# EAGLE design TLC._V_1_1_3 (EAGLE 9.6.2)
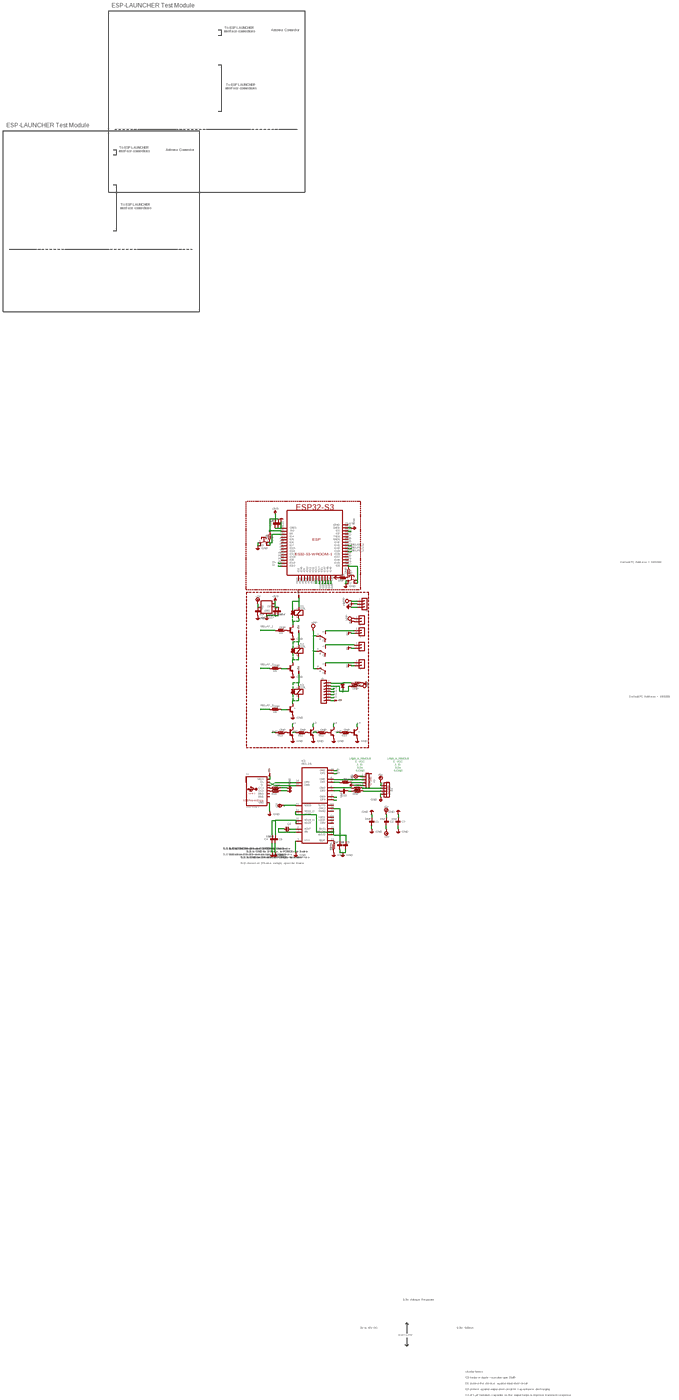
[diagram p0: schematic, sheet 1, overview]
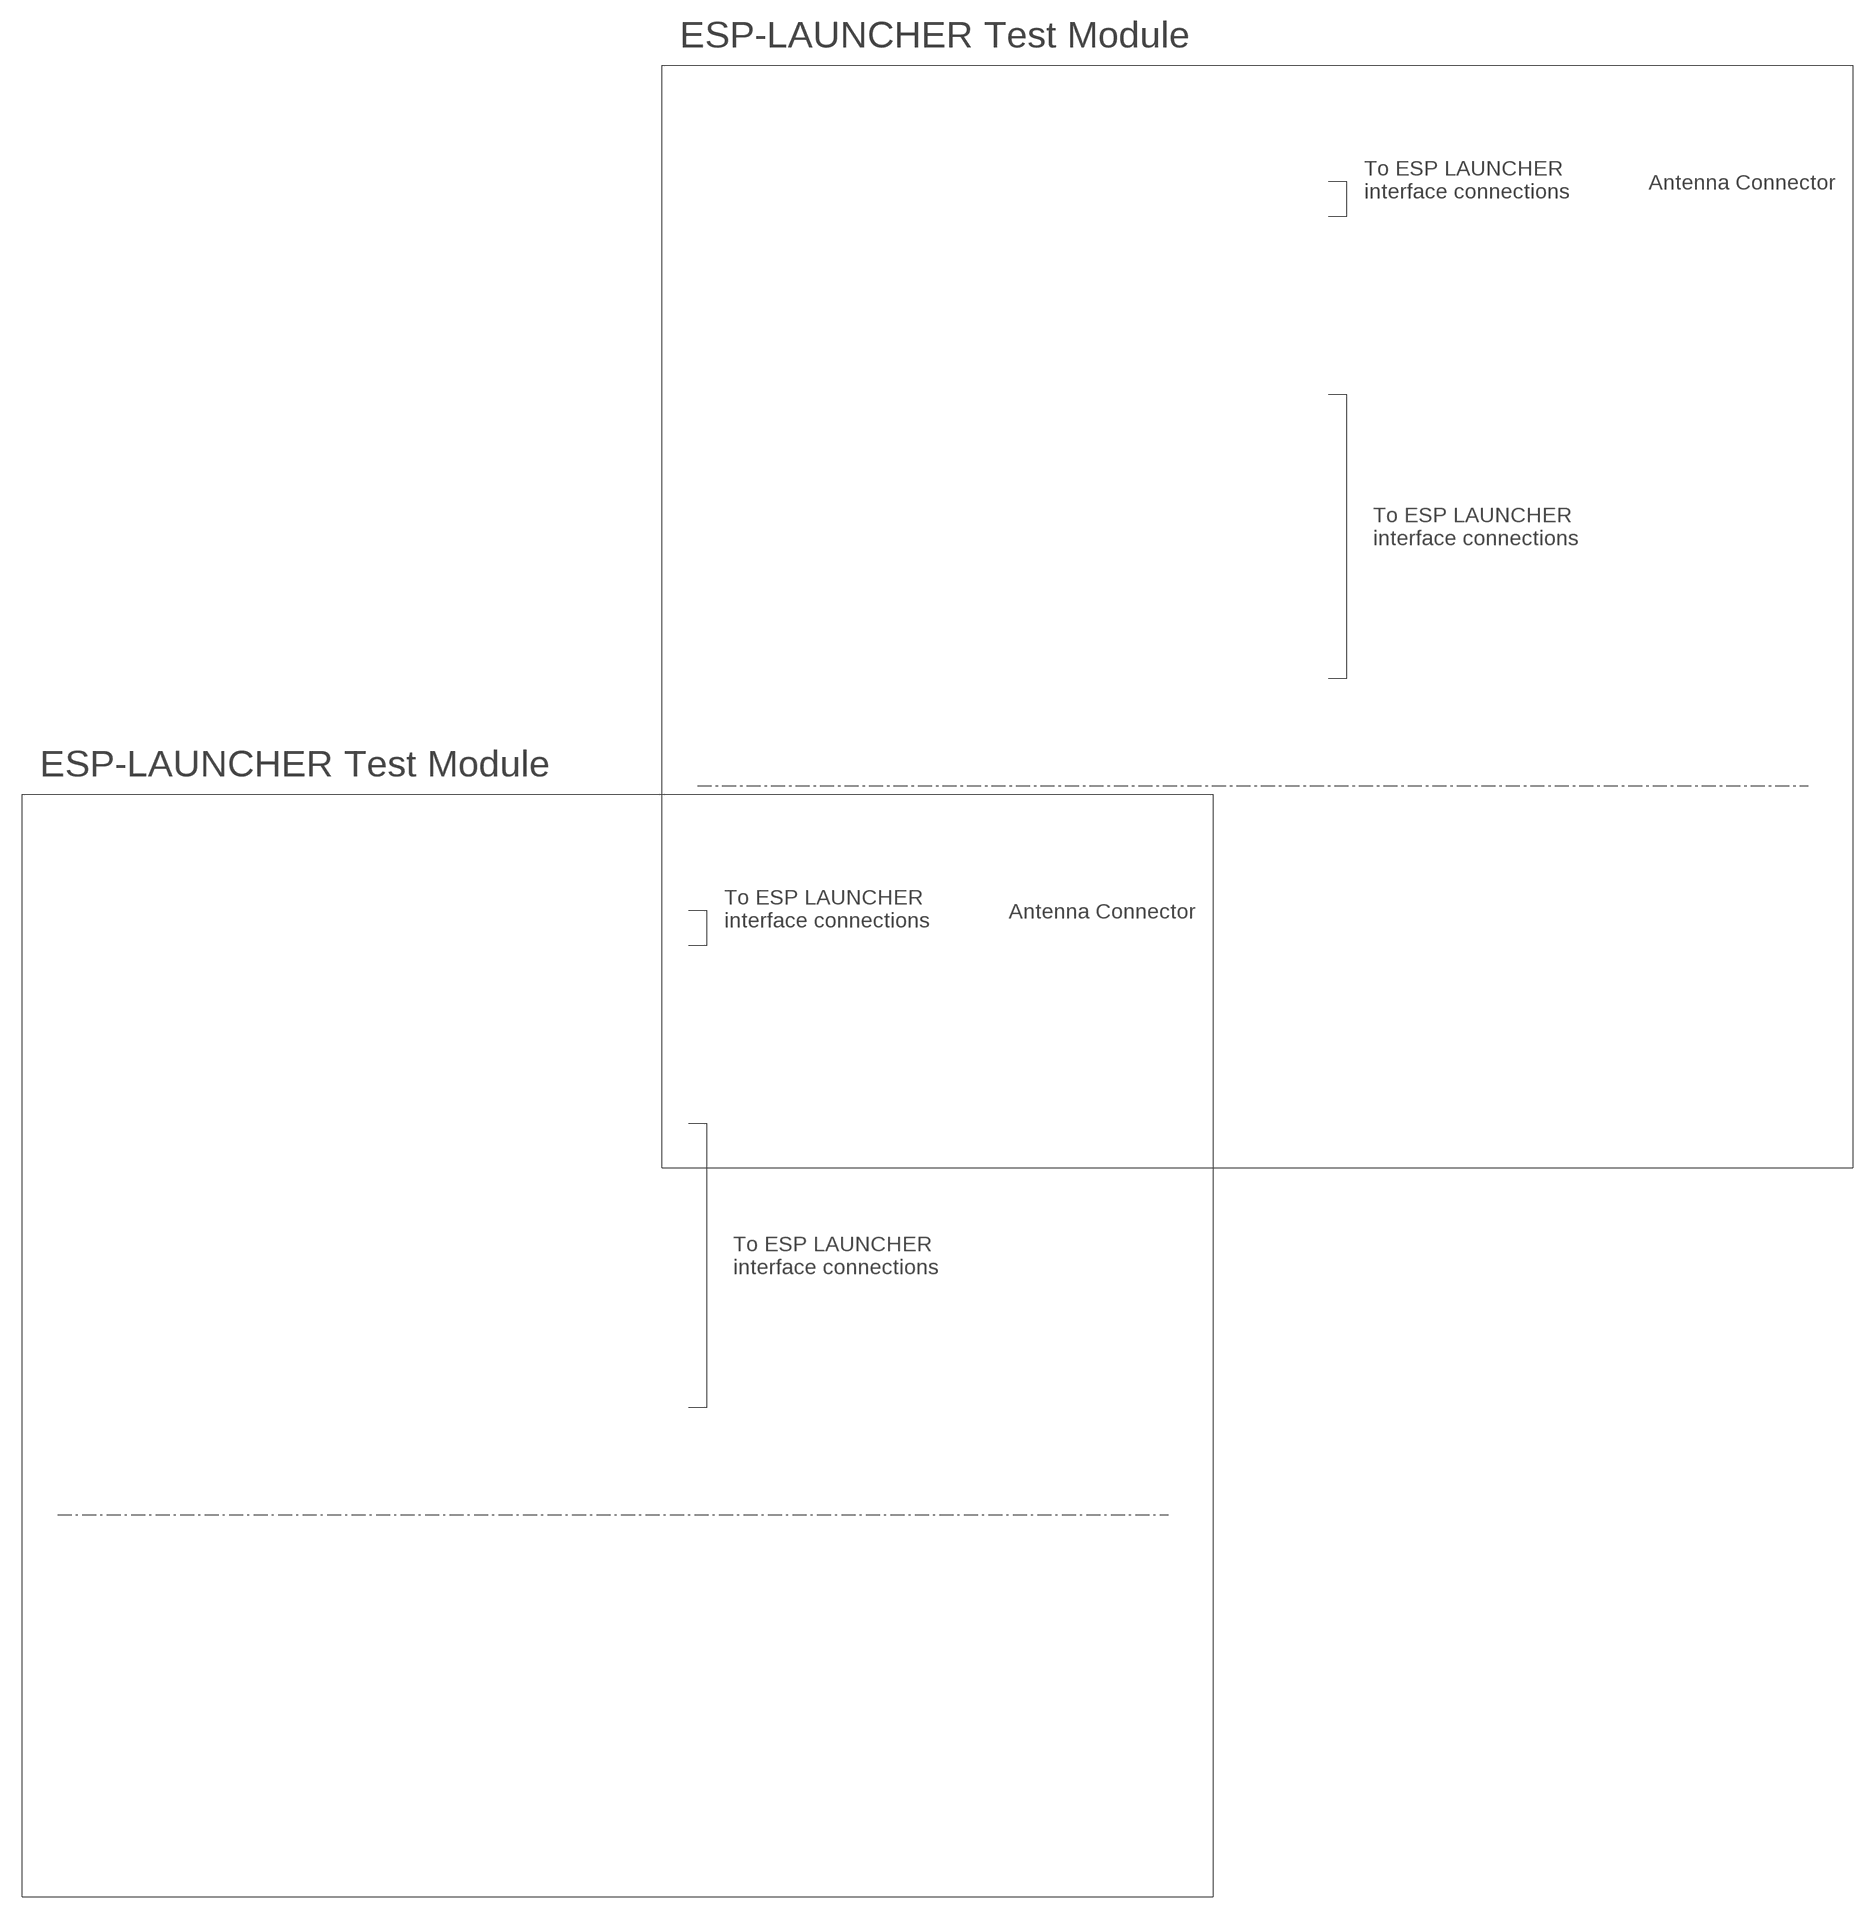
[diagram p1: schematic, sheet 1, part 1 of 4]
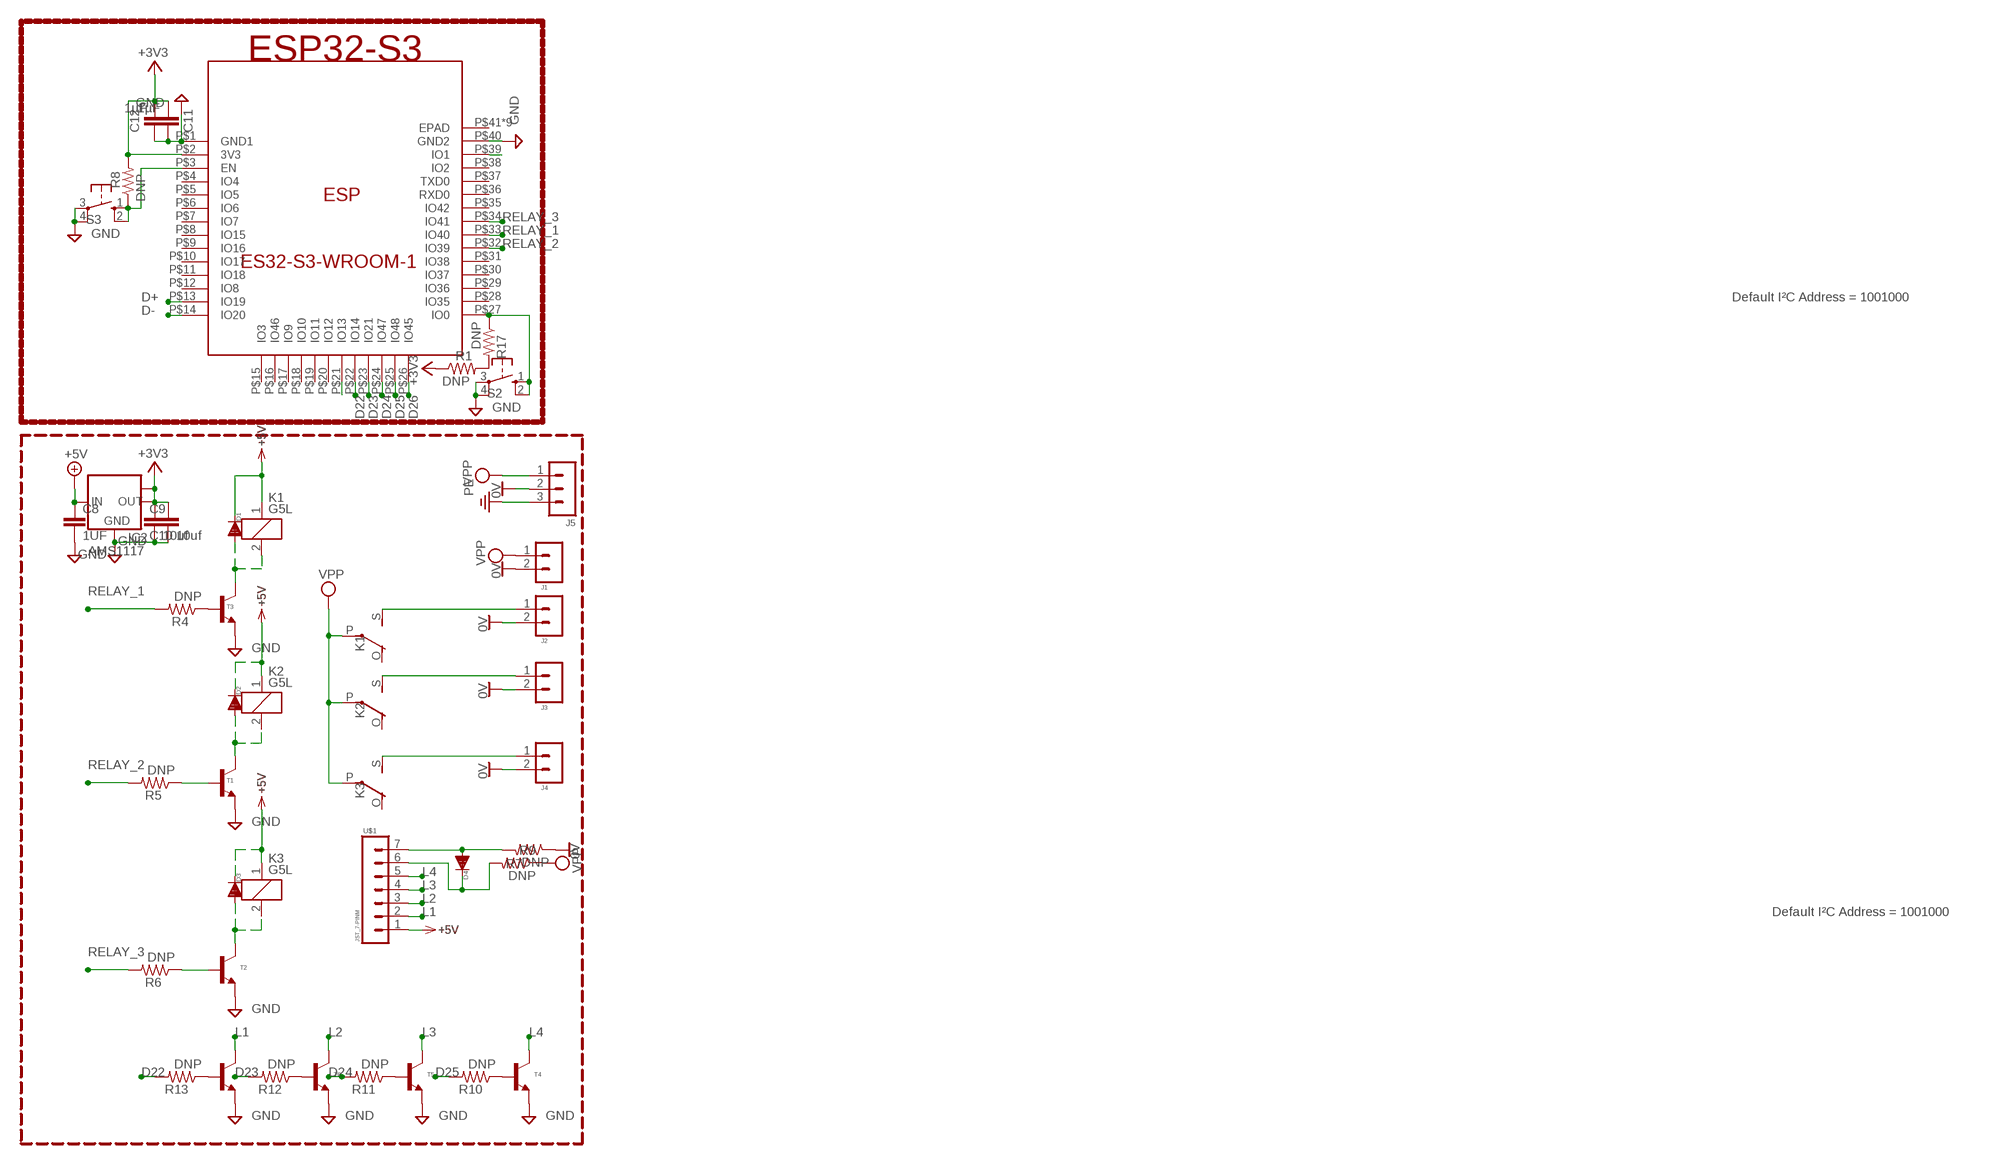
[diagram p2: schematic, sheet 1, part 2 of 4]
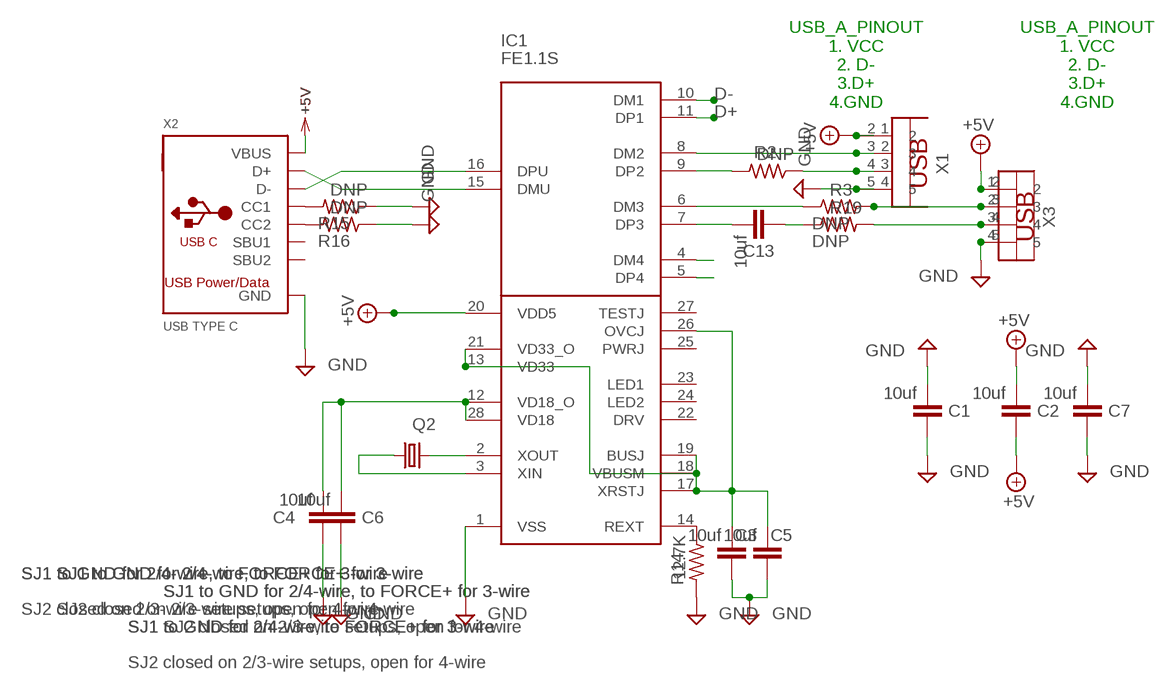
[diagram p3: schematic, sheet 1, part 3 of 4]
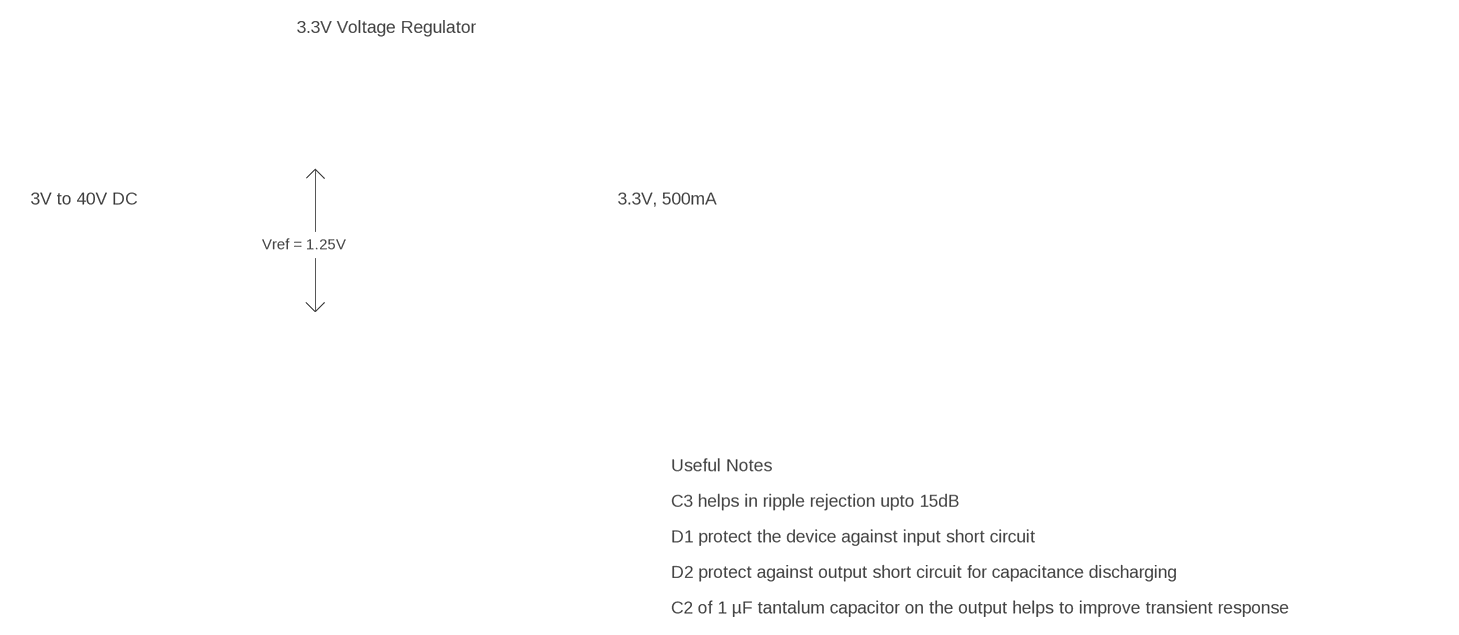
[diagram p4: schematic, sheet 1, part 4 of 4]

## Parts
C1  10uf  C-EUC1206K  [C1206K]
C2  10uf  C-EUC1206K  [C1206K]
C3  10uf  C-EUC1206K  [C1206K]
C4  10uf  C-EUC1206K  [C1206K]
C5  10uf  C-EUC1206K  [C1206K]
C6  10uf  C-EUC1206K  [C1206K]
C7  10uf  C-EUC1206K  [C1206K]
C8  1UF  C-EUC1206K  [C1206K]
C9  10uf  C-EUC1206K  [C1206K]
C10  10uf  C-EUC1206K  [C1206K]
C11  1µF  C-EUC0805K  [C0805K]
C12  1µF  C-EUC0805K  [C0805K]
C13  10uf  C-EUC1206K  [C1206K]
D1  DIODE80  [SOD-80]
D2  DIODE80  [SOD-80]
D3  DIODE80  [SOD-80]
D4  DIODE80  [SOD-80]
ESP  ES32-S3-WROOM-1  [ESP32-S3-WROOM-1]
IC1  FE1.1S  [SOP64P600X175-28N]
IC2  AMS1117  LM1117MPX-5.0  [SOT223]
J1  JST_2-PIN_1.27MMBPT_3.5MM  [BPT-2_PIN_3.5MM]
J2  JST_2-PIN_1.27MMBPT_3.5MM  [BPT-2_PIN_3.5MM]
J3  JST_2-PIN_1.27MMBPT_3.5MM  [BPT-2_PIN_3.5MM]
J4  JST_2-PIN_1.27MMBPT_3.5MM  [BPT-2_PIN_3.5MM]
J5  JST_3-PINPWR_3  [3-PIN_3.96_PWR]
K1  G5L  [G5LE]
K2  G5L  [G5LE]
K3  G5L  [G5LE]
Q2  CRYSTALSM49  [SM49]
R1  DNP  R-US_VMTB60  [VMTB60]
R2  DNP  R-US_R1206  [R1206]
R3  DNP  R-US_VMTB60  [VMTB60]
R4  DNP  R-US_R0603  [R0603]
R5  DNP  R-US_R0603  [R0603]
R6  DNP  R-US_R1206  [R1206]
R7  DNP  R-US_R0603  [R0603]
R8  DNP  R-US_R0603  [R0603]
R9  DNP  R-US_R0603  [R0603]
R10  DNP  R-US_R0603  [R0603]
R11  DNP  R-US_R0603  [R0603]
R12  DNP  R-US_R0603  [R0603]
R13  DNP  R-US_R0603  [R0603]
R14  12.7K  R-US_R0805  [R0805]
R15  DNP  R-US_R1206  [R1206]
R16  DNP  R-US_R0603  [R0603]
R17  DNP  R-US_R0805  [R0805]
R19  DNP  R-US_VMTB60  [VMTB60]
S2  10-XX  [B3F-10XX]
S3  10-XX  [B3F-10XX]
T1  TRANSISTOR_NPNSOT-23  [SOT-23]
T2  TRANSISTOR_NPNSOT-23  [SOT-23]
T3  TRANSISTOR_NPNSOT-23  [SOT-23]
T4  TRANSISTOR_NPNSOT-23  [SOT-23]
T5  TRANSISTOR_NPNSOT-23  [SOT-23]
T6  TRANSISTOR_NPNSOT-23  [SOT-23]
T7  TRANSISTOR_NPNSOT-23  [SOT-23]
U$1  JST_7-PINM  [MOLEX_7-PIN]
U$2  1.27_4PIN  [1.27_4PIN]
U$3  1.27_4PIN  [1.27_4PIN]
X1  PN87520  [PN87520]
X2  USB TYPE C  USB_C  [USB_C_CUSB31-CFM2AX-01-X]
X3  PN87520  [PN87520]

## Nets
0V: J1.2 J2.2 J3.2 J4.2 J5.2 R9.1
+3V3: C9.1 C10.1 C11.2 C12.2 ESP.P$2(3V3) IC2.2(OUT) IC2.TAB(OUT1) R1.1 R8.2
+5V: C2.1 C2.2 C8.1 D1.K D2.K D3.K IC1.20(VDD5) IC2.3(IN) K1.1 K2.1 K3.1 U$1.1 U$2.2 U$3.2 X1.1 X2.A4B9(VBUS) X2.B4A9(VBUS) X3.1
D22: ESP.P$22(IO14) R13.2
D23: ESP.P$23(IO21) R12.2
D24: ESP.P$24(IO47) R11.2
D25: ESP.P$25(IO48) R10.2
D26: ESP.P$26(IO45)
D+: ESP.P$13(IO19) IC1.11(DP1)
D-: ESP.P$14(IO20) IC1.10(DM1)
GND: C1.1 C1.2 C3.1 C4.1 C5.1 C6.1 C7.1 C7.2 C8.2 C9.2 C10.2 C11.1 C12.1 ESP.P$1(GND1) ESP.P$40(GND2) IC1.1(VSS) IC2.1(GND) R14.2 R15.1 R16.1 S2.3(P) S2.4(P1) S3.3(P) S3.4(P1) T1.2(E) T2.2(E) T3.2(E) T4.2(E) T5.2(E) T6.2(E) T7.2(E) U$2.5 U$3.5 X1.4 X2.A1B12(GND) X2.B1A12(GND) X3.4
L1: T7.3(C) U$1.2
L2: T6.3(C) U$1.3
L3: T5.3(C) U$1.4
L4: T4.3(C) U$1.5
N$1: R3.2 U$2.3 X3.2
N$2: C13.2 IC1.7(DP3)
N$3: ESP.P$39(IO1)
N$4: ESP.P$21(IO13)
N$5: IC1.8(DM2) U$3.3 X1.2
N$6: R5.1 T1.1(B)
N$7: D4.K R7.2 U$1.6
N$8: R4.1 T3.1(B)
N$9: J4.1 K3.S(2:S)
N$10: D1.A K1.2 T3.3(C)
N$11: D4.A R9.2 U$1.7
N$12: D2.A K2.2 T1.3(C)
N$13: R10.1 T4.1(B)
N$14: R6.1 T2.1(B)
N$15: ESP.P$3(EN) R8.1 S3.1(S) S3.2(S1)
N$16: R19.2 U$2.4 X3.3
N$17: IC1.4(DM4)
N$18: D3.A K3.2 T2.3(C)
N$19: J3.1 K2.S(2:S)
N$20: J2.1 K1.S(2:S)
N$21: IC1.2(XOUT) Q2.2
N$22: R11.1 T5.1(B)
N$23: IC1.3(XIN) Q2.1
N$24: R12.1 T6.1(B)
N$25: IC1.14(REXT) R14.1
N$26: R13.1 T7.1(B)
N$27: IC1.5(DP4)
N$28: C3.2 C5.2 IC1.13(VD33) IC1.17(XRSTJ) IC1.18(VBUSM) IC1.19(BUSJ) IC1.21(VD33_O) IC1.26(OVCJ)
N$29: ESP.P$27(IO0) R17.1 S2.1(S) S2.2(S1)
N$30: C4.2 C6.2 IC1.12(VD18_O) IC1.28(VD18)
N$31: IC1.9(DP2) R2.2
N$32: IC1.16(DPU) X2.A7(D-) X2.B7(D-)
N$33: IC1.15(DMU) X2.A6(D+) X2.B6(D+)
N$34: R15.2 X2.A5(CC1)
N$35: R16.2 X2.B5(CC2)
N$36: R2.1 U$3.4 X1.3
N$37: R1.2 R17.2
N$38: IC1.6(DM3) R3.1
N$39: C13.1 R19.1
PE: J5.3
RELAY_1: ESP.P$33(IO40) R4.2
RELAY_2: ESP.P$32(IO39) R5.2
RELAY_3: ESP.P$34(IO41) R6.2
VPP: J1.1 J5.1 K1.P(2:P) K2.P(2:P) K3.P(2:P) R7.1
Unconnected: ESP.P$4(IO4) ESP.P$5(IO5) ESP.P$6(IO6) ESP.P$7(IO7) ESP.P$8(IO15) ESP.P$9(IO16) ESP.P$10(IO17) ESP.P$11(IO18) ESP.P$12(IO8) ESP.P$15(IO3) ESP.P$16(IO46) ESP.P$17(IO9) ESP.P$18(IO10) ESP.P$19(IO11) ESP.P$20(IO12) ESP.P$28(IO35) ESP.P$29(IO36) ESP.P$30(IO37) ESP.P$31(IO38) ESP.P$35(IO42) ESP.P$36(RXD0) ESP.P$37(TXD0) ESP.P$38(IO2) ESP.P$41(EPAD) ESP.P$42(EPAD) ESP.P$43(EPAD) ESP.P$44(EPAD) ESP.P$45(EPAD) ESP.P$46(EPAD) ESP.P$47(EPAD) ESP.P$48(EPAD) ESP.P$49(EPAD) IC1.22(DRV) IC1.23(LED1) IC1.24(LED2) IC1.25(PWRJ) IC1.27(TESTJ) K1.O(2:O) K2.O(2:O) K3.O(2:O) X2.A8(SBU1) X2.B8(SBU2)

## Notes on the sheet
- ESP-LAUNCHER Test Module
- Antenna Connector
- To ESP LAUNCHER
  interface connections
- To ESP LAUNCHER
  interface connections
- ESP-LAUNCHER Test Module
- Antenna Connector
- To ESP LAUNCHER
  interface connections
- To ESP LAUNCHER
  interface connections
- Default I²C Address = 1001000
- Default I²C Address = 1001000
- USB_A_PINOUT
  1. VCC
  2. D-
  3.D+
  4.GND
- USB_A_PINOUT
  1. VCC
  2. D-
  3.D+
  4.GND
- USB Power/Data
- SJ1 to GND for 2/4-wire, to FORCE+ for 3-wire | SJ1 to GND for 2/4-wire, to FORCE+ for 3-wire | SJ1 to GND for 2/4-wire, to FORCE+ for 3-wire | SJ1 to GND for 2/4-wire, to FORCE+ for 3-wire
- SJ1 to GND for 2/4-wire, to FORCE+ for 3-wire | SJ1 to GND for 2/4-wire, to FORCE+ for 3-wire
- SJ2 closed on 2/3-wire setups, open for 4-wire | SJ2 closed on 2/3-wire setups, open for 4-wire
- SJ1 to GND for 2/4-wire, to FORCE+ for 3-wire | SJ1 to GND for 2/4-wire, to FORCE+ for 3-wire | SJ2 closed on 2/3-wire setups, open for 4-wire
- SJ2 closed on 2/3-wire setups, open for 4-wire
- 3.3V Voltage Regulator
- 3V to 40V DC | 3.3V, 500mA
- Vref = 1.25V
- Useful Notes
- C3 helps in ripple rejection upto 15dB
- D1 protect the device against input short circuit
- D2 protect against output short circuit for capacitance discharging
- C2 of 1 µF tantalum capacitor on the output helps to improve transient response

## Library data of the parts
C1-C13 = rcl:C-EU: CAPACITOR, European symbol; SPICEPREFIX: C
D1-D4 = Squadron:DIODE
ESP = ESP32 Module:ES32-S3-WROOM-1
IC1 = FE1.1S:FE1.1S: Check availability <https://pricing.snapeda.com/parts/FE1.1S/terminus/view-part?ref=eda>; AVAILABILITY: In Stock; CHECK_PRICES: https://www.snapeda.com/parts/FE1.1S/Terminus/view-part/?ref=eda; DESCRIPTION: USB 2.0 HIGH SPEED 4-PORT HUB CONTROLLER; MF: terminus; MP: FE1.1S; PACKAGE: None; PRICE: None; SNAPEDA_LINK: https://www.snapeda.com/parts/FE1.1S/Terminus/view-part/?ref=snap
IC2 = lm1117:LM1117MPX-*
J1-J4 = Squadron:JST_2-PIN_1.27MM
J5 = Squadron:JST_3-PIN
K1-K3 = relay:G5L: RELAY 1 x switch, 10 A/120 V AC, 8 A/30 V ADC, Omron
Q2 = adafruit:CRYSTAL: CRYSTAL; OC_FARNELL: unknown; OC_NEWARK: unknown
R1-R17 R19 = rcl:R-US_: RESISTOR, American symbol; SPICEPREFIX: R
S2 S3 = switch-omron:10-XX: OMRON SWITCH; MPN: B3F-1000; OC_FARNELL: 176432; OC_NEWARK: 36M3542
T1-T7 = Squadron:TRANSISTOR_NPN
U$1 = Squadron:JST_7-PIN
U$2 U$3 = 1.27mm connector:1.27_4PIN
X1 X3 = con-berg:PN87520: BERG USB connector; OC_FARNELL: unknown; OC_NEWARK: unknown
X2 = adafruit_electromech:USB_C: USB Type-C USB 2.0 Connector

## Module WAVESHAREDISPLAY
Ports: 

### Library data of the parts

## Board
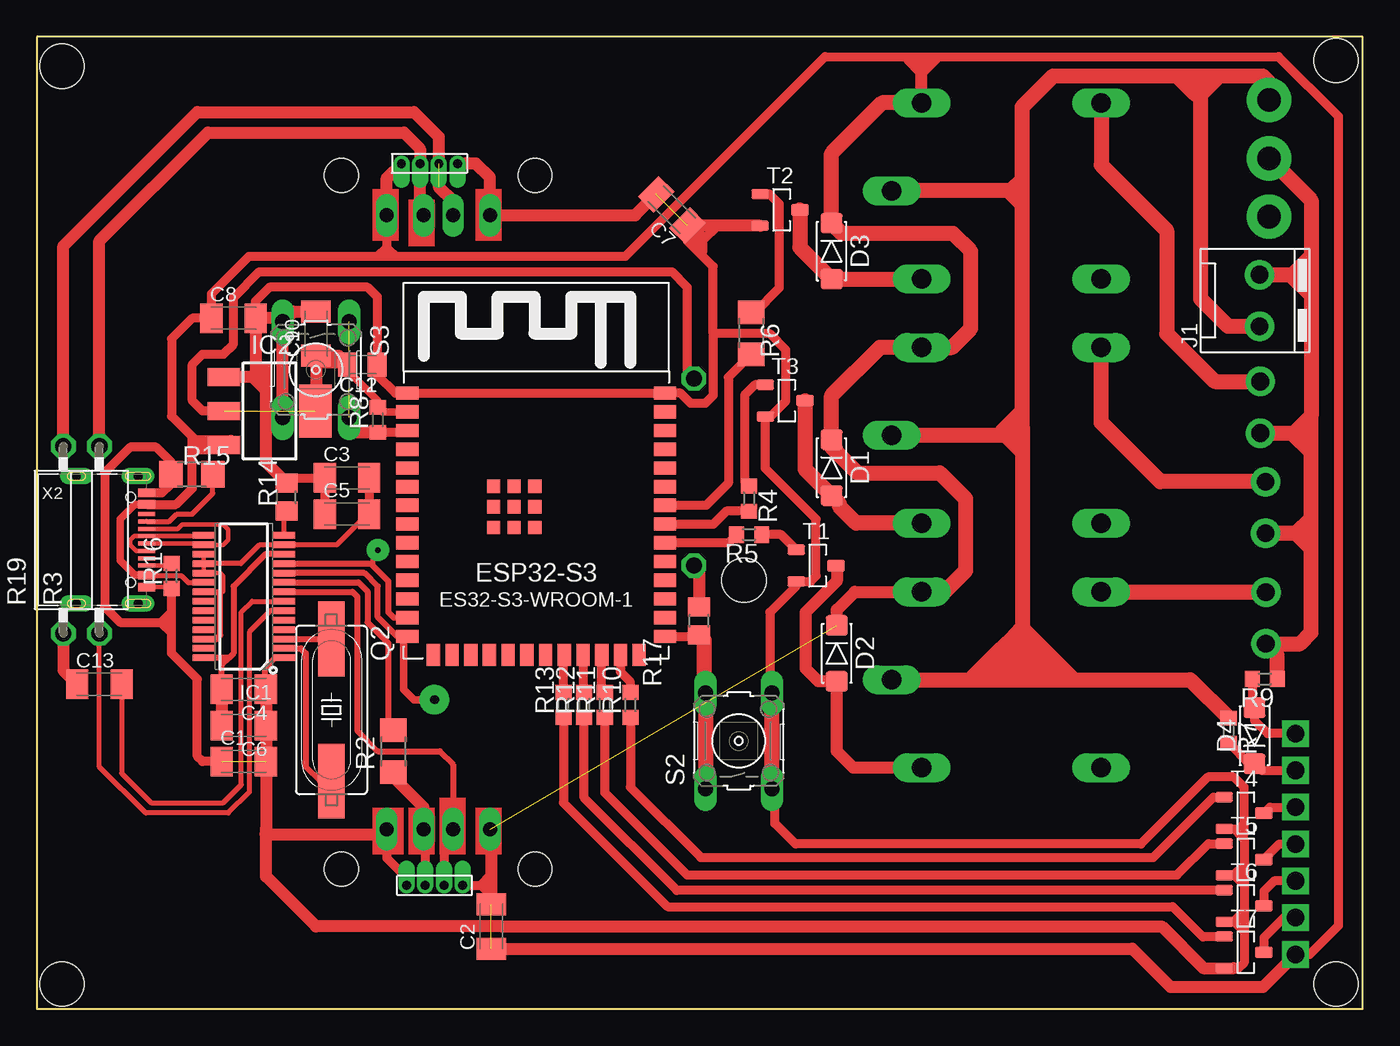
[diagram p5: board, top side]
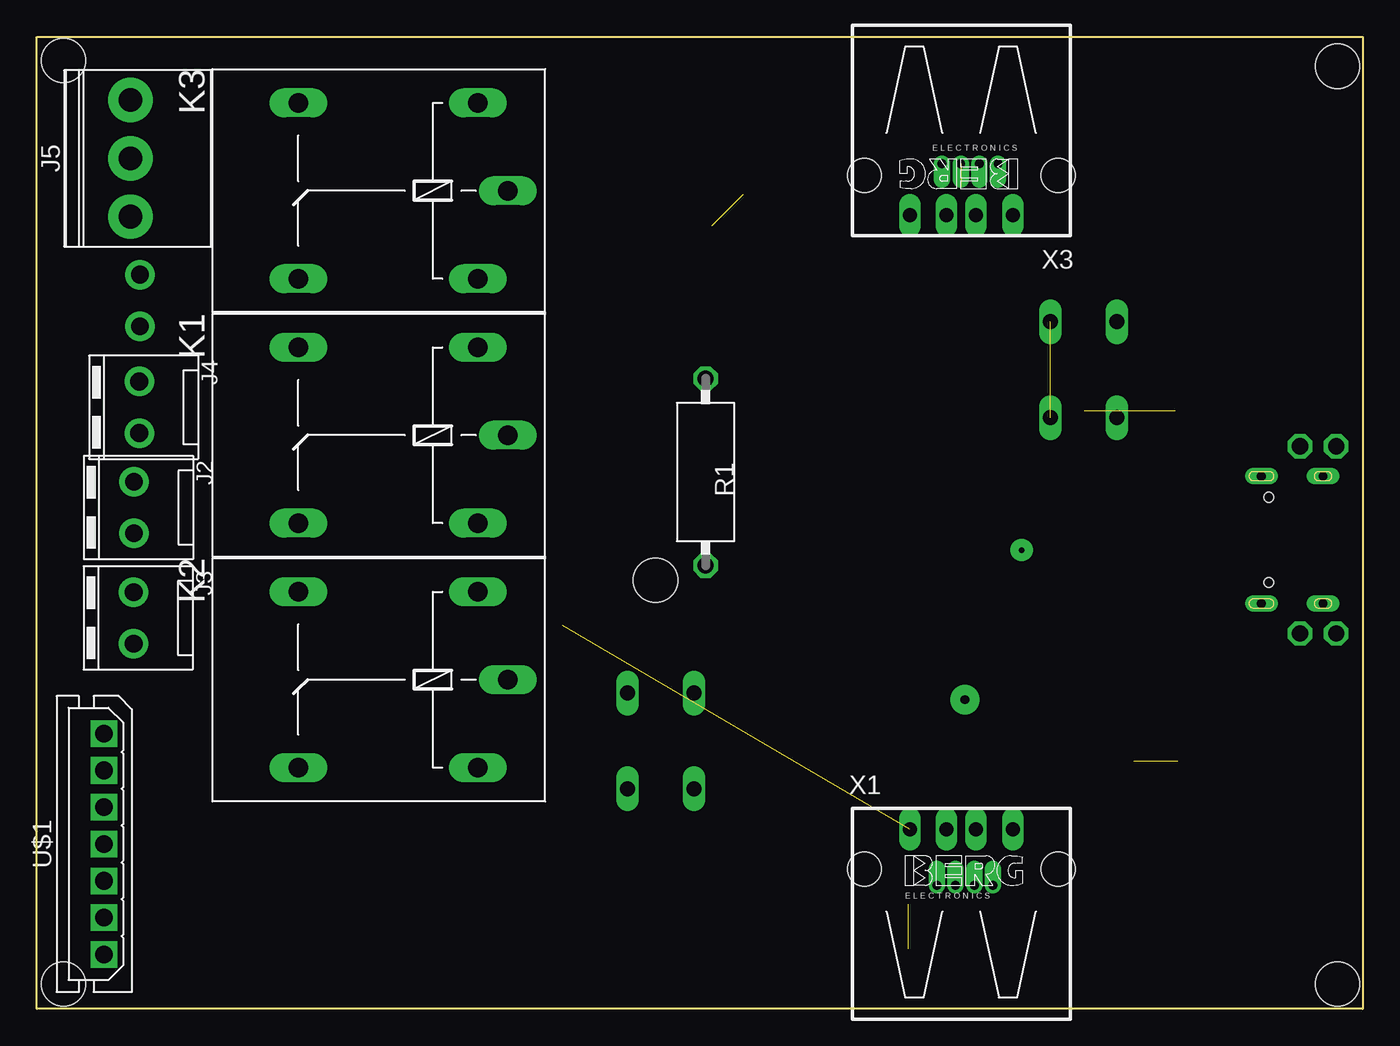
[diagram p6: board, bottom side, seen from below]

Size 90 x 66 mm. Coordinates in mm from the lower left corner, seen from the top.
Outline: 0,0 90,0 90,66 0,66 0,0
Copper layers (1*16): Top 0.035mm / dielectric 1.5mm / Bottom 0.035mm
Design rules "default": minimum track width 6mil, minimum drill 0.35mm, track to track 6mil, track to pad 6mil, pad to pad 6mil, via to via 6mil, smd to smd 6mil, copper to edge 40mil, drill to drill 6mil, minimum pad ring 10mil, minimum via ring 8mil, stop-mask expansion 4mil, vias tented up to drill 0mil, thermal gap 10mil
Holes 3 mm at 1.7,1.7 1.7,64 88.2,64.4 88.2,1.7 48,29.1

### Footprints (pad centres in the part's own frame; a part is rotated, then mirrored left to right if it is on the bottom)
C1206K = smd 1.5 x 2: 1 -1.5,0; 2 1.5,0
C0805K = smd 1.3 x 1.6: 1 -1,0; 2 1,0
SOD-80 = smd 1.4 x 1.5: A -1.9,0; K 1.9,0
ESP32-S3-WROOM-1 = smd 1.5 x 0.9: P$1 0.25,18.01; P$2 0.25,16.74; P$3 0.25,15.47; P$4 0.25,14.2; P$5 0.25,12.93; P$6 0.25,11.66; P$7 0.25,10.39; P$8 0.25,9.12; P$9 0.25,7.85; P$10 0.25,6.58; P$11 0.25,5.31; P$12 0.25,4.04; P$13 0.25,2.77; P$14 0.25,1.5; P$27 17.75,1.5; P$28 17.75,2.77; P$29 17.75,4.04; P$30 17.75,5.31; P$31 17.75,6.58; P$32 17.75,7.85; P$33 17.75,9.12; P$34 17.75,10.39; P$35 17.75,11.66; P$36 17.75,12.93; P$37 17.75,14.2; P$38 17.75,15.47; P$39 17.75,16.74; P$40 17.75,18.01 | smd 0.9 x 1.5: P$15 2.015,0.25; P$16 3.285,0.25; P$17 4.555,0.25; P$18 5.825,0.25; P$19 7.095,0.25; P$20 8.365,0.25; P$21 9.635,0.25; P$22 10.905,0.25; P$23 12.175,0.25; P$24 13.445,0.25; P$25 14.715,0.25; P$26 15.985,0.25 | smd 0.9 x 0.9: P$41 6.1,11.69; P$42 7.5,11.69; P$43 8.9,11.69; P$44 6.1,10.29; P$45 7.5,10.29; P$46 8.9,10.29; P$47 6.1,8.89; P$48 7.5,8.89; P$49 8.9,8.89
SOP64P600X175-28N = smd 0.44 x 1.525: 1 -4.16,-2.712; 2 -3.52,-2.712; 3 -2.88,-2.712; 4 -2.24,-2.712; 5 -1.6,-2.712; 6 -0.96,-2.712; 7 -0.32,-2.712; 8 0.32,-2.712; 9 0.96,-2.712; 10 1.6,-2.712; 11 2.24,-2.712; 12 2.88,-2.712; 13 3.52,-2.712; 14 4.16,-2.712; 15 4.16,2.712; 16 3.52,2.712; 17 2.88,2.712; 18 2.24,2.712; 19 1.6,2.712; 20 0.96,2.712; 21 0.32,2.712; 22 -0.32,2.712; 23 -0.96,2.712; 24 -1.6,2.712; 25 -2.24,2.712; 26 -2.88,2.712; 27 -3.52,2.712; 28 -4.16,2.712
SOT223 = smd 1.219 x 2.235: 1 -2.311,-3.099; 2 0,-3.099; 3 2.311,-3.099 | smd 3.6 x 2.2: TAB 0,3.099
BPT-2_PIN_3.5MM = drill 1.2 pad 2: 1 -1.75,0; 2 1.75,0
3-PIN_3.96_PWR = drill 1.6 pad 3: 1 3.96,5.5; 2 0,5.5; 3 -3.96,5.5
G5LE = drill 1.321 long: 1 -7.493,-5.969; 2 -7.493,5.969; O 4.699,5.969; P -9.525,0; S 4.699,-5.969
SM49 = smd 5.08 x 1.778: 1 -4.826,0; 2 4.826,0
VMTB60 = drill 1.1 octagon: 1 -6.35,0; 2 6.35,0
R1206 = smd 1.6 x 1.803: 1 -1.422,0; 2 1.422,0
R0603 = smd 1 x 1.1: 1 -0.85,0; 2 0.85,0
R0805 = smd 1.3 x 1.5: 1 -0.95,0; 2 0.95,0
B3F-10XX = drill 1.016 long: 1 -3.251,2.261; 2 3.251,2.261; 3 -3.251,-2.261; 4 3.251,-2.261
SOT-23 = smd 0.7 x 1.2: 1 -1.077,-1.35; 2 1.077,-1.35 | smd 0.8 x 1.2: 3 0,1.35
MOLEX_7-PIN = drill 1.2 pad 1.75 square: 1 7.5,0; 2 5,0; 3 2.5,0; 4 0,0; 5 -2.5,0; 6 -5,0; 7 -7.5,0
1.27_4PIN = drill 0.6 pad 1 offset: 2 -1.905,0; 3 -0.635,0; 4 0.635,0; 5 1.905,0
PN87520 = drill 0.95 long: 1 -3.5,2.71; 2 -1,2.71; 3 1,2.71; 4 3.5,2.71 | hole 2.3: -6.57,0; 6.57,0
USB_C_CUSB31-CFM2AX-01-X = smd 0.575 x 1.15: A1B12 -3.2,3.545; A4B9 -2.4,3.545; B1A12 3.2,3.545; B4A9 2.4,3.545 | smd 0.275 x 1.15: A5 -1.25,3.545; A6 -0.25,3.545; A7 0.25,3.545; A8 1.25,3.545; B5 1.75,3.545; B6 0.75,3.545; B7 -0.75,3.545; B8 -1.75,3.545 | drill 0.6 pad 1 long: M1 -4.32,2.97; M2 4.32,2.97; M3 -4.32,-1.21; M4 4.32,-1.21 | hole 0.65: 2.89,2.47; -2.89,2.47

### Placement (x,y rotation side)
C1  14.05,16.8 0 top
C2  30.85,5.6 90 top
C3  21.05,36.05 0 top
C4  14.05,21.7 180 top
C5  21.05,33.6 0 top
C6  14.05,19.25 180 top
C7  43.1,54.25 135 top
C8  13.35,46.9 0 top
C9  18.95,45.85 90 top
C10  18.95,45.85 90 top
C11  22.1,43.75 180 top
C12  22.1,43.75 180 top
C13  4.25,22.05 0 top
D1  53.95,36.75 90 top
D2  54.3,24.15 90 top
D3  53.95,51.45 90 top
D4  82.65,18.55 270 top
ESP  24.9,23.8 0 top
IC1  14.05,28 90 top
IC2  15.8,40.6 270 top
J1  83,48.1 90 top
J2  83.4,34.05 270 bottom
J3  83.43,26.55 270 bottom
J4  83.05,40.85 270 bottom
J5  78.15,57.75 90 bottom
K1  67.55,38.95 180 bottom
K2  67.55,22.35 180 bottom
K3  67.55,55.55 180 bottom
Q2  20,20.3 270 top
R1  44.6,36.45 270 bottom
R2  24.2,17.5 90 top
R3  4.25,31.85 90 top
R4  48.35,34.65 270 top
R5  48.35,32.2 180 top
R6  48.5,45.87 270 top
R7  80.9,18.9 270 top
R8  23.15,40 90 top
R9  83.35,22.4 180 top
R10  40.3,20.65 90 top
R11  38.55,20.65 90 top
R12  37.15,20.65 90 top
R13  35.75,20.65 90 top
R14  16.95,34.75 90 top
R15  10.53,36.3 0 top
R16  9.15,29.4 90 top
R17  44.95,26.35 90 top
R19  1.8,31.85 90 top
S2  47.65,18.2 90 top
S3  18.95,43.4 270 top
T1  52.9,30.1 270 top
T2  50.45,54.25 270 top
T3  50.8,41.3 270 top
T4  81.95,13.3 270 top
T5  81.95,10.15 270 top
T6  81.95,7 270 top
T7  81.95,3.85 270 top
U$1  85.45,11.2 270 bottom
U$2  26.65,57.4 0 top
U$3  27,8.4 180 top
X1  27.25,9.5 0 bottom
X2  3.9,31.85 270 top
X3  27.25,56.6 180 bottom

### Tracks (layer width: path | path; a pad name or v marks a point on that pad's centre or on a via)
0V
  Top 1.016: R9.1 84.2,24.03 J3.2 85.75,24.8 86.5,25.55 86.5,31.25 | 86.5,31.25 86.5,32.55 | 86.5,32.55 86.5,33.35 | 85.45,32.3 86.25,32.3 86.5,32.55 | 85.45,32.3 86.5,33.35 | 85.45,32.3 86.5,31.25 | J4.2 85.2,39.1 | 85.35,39.1 86.25,39.1 86.5,38.85 | 86.5,33.35 86.5,37.8 | 86.5,37.8 86.5,38.85 | 86.5,38.85 86.5,40.25 | 86.5,51.1 86.5,54.9 J5.2 | 86.5,51.1 86.5,49.5 | 86.5,49.5 86.5,48.45 | 86.5,40.25 86.5,48.4 86.5,48.45 | 85.2,39.1 85.35,39.1 | 85.35,39.1 86.5,40.25 | 85.2,39.1 86.5,37.8 | J2.2 85.45,32.3 | J1.2 85.1,49.85 | 85.25,49.85 86.15,49.85 86.5,49.5 | 86.5,51.1 85.25,49.85 | 85.25,49.85 85.1,49.85 | 85.1,49.85 86.5,48.45
+3V3  (1 unrouted)
  Top 0.508: C10.1 19.55,43.75 C11.2 21.45,43.4 21.45,43 23.15,41.3 R8.2 23.46,40.54 ESP.P$2 | IC2.TAB 18.9,39.6 18.95,39.55
  Top 0.61: 18.95,40.6 IC2.TAB 19.15,40.85 | IC2.2 11.25,40.6 10.55,41.3 10.55,43.75 11.25,44.45 12.65,44.45 13.35,45.15 13.35,48.3 15.1,50.05 43.1,50.05 44.15,49 44.15,43.25 R1.1
  Top 0.813: 18.95,40.6 C10.1 20.5,44.35 C11.2
+5V  (2 unrouted)
  Top 0.152: X2.A4B9 7.4,34.25
  Top 0.305: 11.25,28.96 IC1.20
  Top 0.35: 7.5,29.4 9.83,29.4 10.28,28.95 11.33,28.95 IC1.20
  Top 0.406: X2.B4A9 7.5,29.4
  Top 0.508: X2.B4A9 6.65,29.45 5.65,30.45 5.65,33.25 6.65,34.25 7.4,34.25
  Top 0.61: 24.2,51.1 39.95,51.1 53.52,64.67 84.28,64.67 88.35,60.6 88.35,5.65 86.4,3.7 U$1.1 | 23.15,51.1 14.4,51.1 11.85,48.55 C8.1 10.55,46.9 9.15,45.5 9.15,40.25 10.55,38.85 | 23.15,51.1 24.2,51.1 | IC2.3 12.56,38.15 | 10.55,38.85 10.72,38.67 | 11.11,38.29 10.72,38.67 | 11.11,38.29 IC2.3 | X2.A4B9 9.45,34.25 10.55,35.35 10.55,37.8 | 10.55,37.8 10.55,38.85 | 10.55,37.8 10.72,37.98 | 10.72,37.98 11.04,38.29 11.11,38.29 | 10.72,38.67 10.72,37.98 | 10.72,37.98 12.39,37.98 IC2.3 | 10.72,38.67 13.18,38.67 13.35,38.5 | X3.1 23.75,51.7 | 23.15,51.1 23.75,51.7 | 23.75,51.7 24.2,51.25 24.2,51.1 | U$3.2 30.15,8.4 | 30.85,8.4 30.15,8.4 | 30.15,8.4 30.85,9.1 | 30.15,8.4 30.85,7.7
  Top 0.813: C2.1 74.35,4.1 76.95,1.5 83.25,1.5 U$1.1 | 30.75,7.2 C2.2 30.85,7.7 30.85,8.4 30.85,9.1 30.85,12.11 X1.1 | D2.K 54.3,27.1 55.52,28.32 K2.1 | K3.1 60.06,63.61 | 60.06,63.64 60.06,64.34 59.9,64.5 | 60.06,63.61 60.95,64.5 | 60.06,63.61 60.06,63.64 | 60.06,63.64 59.2,64.5 | X3.1 23.75,56.41 U$2.2
  Top 1.016: K2.1 61.62,28.32 63.05,29.75 63.05,34.65 61.3,36.4 55.7,36.4 53.95,38.15 D1.K 53.95,41.65 57.22,44.92 K1.1 62.12,44.92 63.4,46.2 63.4,51.45 62.2,52.65 54.65,52.65 D3.K 53.95,58.1 57.37,61.52 K3.1
D22
  Top 0.61: R13.2 35.75,24 ESP.P$22
D23
  Top 0.61: ESP.P$23 37.08,21.57 R12.2
D24
  Top 0.61: R11.2 38.34,21.7 ESP.P$24
D25
  Top 0.61: ESP.P$25 39.62,22.89 40.3,22.2 R10.2
D+  (via drill 0.35 pad 1.5)
  Top 0.35: 23.32,29.57 22.8,30.1 22.8,30.8 v23.15,31.15
  Top 0.406: IC1.11 22.66,30.24 23.32,29.57 23.85,29.05 23.85,26.95 24.23,26.57 ESP.P$13
D-  (via drill 0.6 pad 2)
  Top 0.406: ESP.P$14 24.45,25.3 23.15,26.6 23.15,28.7 22.25,29.6 IC1.10
  Top 0.508: ESP.P$14 24.9,25.05 24.9,21.7 25.6,21 v27,21
GND  (2 unrouted)
  Top 0.305: 9.15,28.35 R16.1 9.05,28.65 X2.B1A12
  Top 0.406: IC1.1 16.19,23.84 15.45,23.1 15.45,21.8 C4.1
  Top 0.61: T2.2 46.22,53.17 45.2,52.15 | 45.9,45.85 45.9,50.4 45.2,51.1 | 45.2,52.15 | 45.9,45.85 45.9,41.65 45.36,41.11 44.4,41.11 43.7,41.81 ESP.P$40 ESP.P$1 24.34,41.81 23.1,43.05 C11.1 | 45.9,45.85 49.75,45.85 50.85,44.75 50.85,41.27 49.8,40.22 T3.2 49.45,36.7 52.9,33.25 52.9,29.4 52.52,29.02 T1.2 51.55,28.72 49.75,26.92 49.75,21.61 S2.4 50.1,21.64 50.1,12.6 51.5,11.2 74.95,11.2 79.5,15.75 81.25,15.75 81.95,15.05 81.95,12.6 | C11.1 23.1,48.35 22.45,49 15.8,49 14.85,48.05 C8.2 | IC2.1 12.7,43.05 | 23.25,43.9 C11.1 | 81.78,11.72 81.28,12.22 T4.2 81.57,12.22 81.95,12.6 | 81.78,11.72 81.95,11.55 81.95,9.8 | 81.95,9.8 81.95,9.45 | 81.95,9.45 81.57,9.07 T5.2 | T6.2 81.57,5.92 81.95,6.3 | 81.95,9.45 81.95,8.4 | 81.95,8.4 81.95,6.65 | 81.95,6.65 81.95,6.3 | 81.95,6.3 81.95,5.25 | 81.95,5.25 81.95,3.15 81.57,2.77 81.25,2.77 T7.2 79.18,2.77 | 81.78,11.72 81.95,11.9 81.95,12.6 | T5.2 81.22,9.07 81.95,9.8 | T5.2 81.28,9.07 81.95,8.4 | T6.2 81.22,5.92 81.95,6.65 | T6.2 81.28,5.92 81.95,5.25 | 31.55,5.6 30.85,5.6 | 30.5,5.6 18.95,5.6 | C1.1 11.25,16.8 10.9,17.15 10.9,22.4 9.15,24.15 9.15,25.55 | 9.15,25.55 9.15,26.25 | 9.15,26.25 9.15,26.95 | 9.15,26.95 9.15,28.35 | 8.45,26.25 5.65,26.25 4.61,27.3 4.61,36.41 6.35,38.15 8.1,38.15 9.11,37.14 R15.1 9.11,35.66 8.5,35.05 X2.A1B12 | 9.15,26.25 8.45,26.25 | 8.45,26.25 9.15,26.95 | 8.45,26.25 9.15,25.55 | C5.1 C3.1 17.3,36.05 R14.2 16.85,35.7 15.9,36.65 | 15.55,12.25 15.55,11.91 15.5,11.86 | 15.47,11.84 15.62,11.69 15.55,11.61 | 45.2,52.15 45.2,52.47 44.5,53.17 | 45.2,52.15 C7.1 44.16,52.14 45.2,51.1 | 45.2,52.15 45.2,51.45 | 45.2,51.45 43.8,52.85 | 45.2,51.1 45.2,51.45 | X1.4 23.75,10.25 25.09,8.9 U$3.5
  Top 0.813: 15.5,11.86 23.4,11.86 X1.4 | C4.1 C6.1 C1.2 15.55,12.25 15.55,11.61 15.55,9 18.95,5.6 31.55,5.6 76.35,5.6 79.18,2.77 81.25,2.77 | 14.85,42.91 C8.2 16.44,46.9 S3.3 | 14.85,42.91 14.96,42.91 15.55,43.5 15.55,42 | 14.85,42.91 14.64,42.91 | 14.64,42.91 IC2.1 | R14.2 15.55,37.1 15.55,39.9 | 15.55,39.9 15.55,40.95 | 15.55,40.95 15.55,42 | 14.64,42.91 15.55,42 | C7.2 40.62,53.89 X3.4 30.75,56.45 29.8,57.4 U$2.5 | T2.2 44.5,53.17 44.18,53.17 C7.1 | S3.4 S3.3 | S3.4 15.8,40.15 15.55,39.9 | 15.55,40.95 16.35,40.15 S3.4 | S3.3 17.39,47.35 C10.2
  Top 1.016: S2.3 S2.4
L1
  Top 0.61: U$1.2 84.65,6.2 83.3,4.85 T7.3
L2
  Top 0.61: U$1.3 84,8.7 83.3,8 T6.3
L3
  Top 0.61: T5.3 84.35,11.2 U$1.4
L4
  Top 0.61: T4.3 83.7,13.7 U$1.5
N$1
  Top 0.305: X3.2 26.3,53.94
  Top 0.813: X3.2 26.02,54.12 U$2.3 26.02,58.4 24.92,59.5 11.6,59.5 4.25,52.15 R3.2
N$2
  Top 0.35: C13.2 5.75,16 7.75,14 12.65,14 13.88,15.23 13.88,26.95 14.61,27.68 IC1.7
N$4
  Top 0.61: ESP.P$21 34.55,24.04
N$5
  Top 0.406: IC1.8 21.43,28.32 21.75,28 21.75,18.9 23.15,17.5 27.35,17.5 28.25,16.6 X1.2
  Top 0.61: X1.2 27.64,11.6 U$3.3
N$6
  Top 0.61: T1.1 50.53,32.2 R5.1
N$7
  Top 0.61: R7.2 82.3,16.65 D4.K 83.1,16.2 U$1.6
N$8
  Top 0.61: R4.1 48.05,35.8 48.05,41.68 48.75,42.38 T3.1
N$9
  Top 1.016: K3.S 72.25,57.3 76.7,52.85 76.7,45.85 79.95,42.6 J4.1
N$10
  Top 1.016: K1.2 55.62,32.98 54.45,34.15 54.45,34.35 D1.A 52.15,36.65 T3.3
N$11
  Top 0.61: R9.2 82.5,20.6 D4.A 82.65,19.6 83.55,18.7 U$1.7
N$12
  Top 0.813: K2.2 55.42,16.38 54.3,17.5 D2.A 53.05,22.25 52.2,23.1 52.2,26.95 54.3,29.05 54.3,30.05 T1.3
N$13
  Top 0.61: T4.1 79.88,14.38 75.78,10.28 45.07,10.28 40.3,15.05 R10.1
N$14
  Top 0.61: T2.1 49.72,55.33 50.39,54.66 50.39,48.94 48.7,47.25 48.54,47.25 R6.1
N$15  (1 unrouted)
  Top 0.61: ESP.P$3 25.03,39.15 R8.1
  Top 0.813: R8.1 21.45,39.15 21.21,39.39 S3.2
N$16  (1 unrouted)
  Top 0.813: X3.3 28.25,54.84 27.29,55.8 | R19.2 1.8,51.8 10.9,60.9 25.6,60.9 27.29,59.22 U$2.4
N$18
  Top 1.016: T2.3 51.8,51.7 D3.A 60.03,49.55 K3.2
N$19
  Top 1.016: K2.S 83.41,28.32 J3.1
N$20
  Top 1.016: J2.1 76.25,35.8 72.25,39.8 K1.S
N$21
  Top 0.406: IC1.2 17.92,24.48 18.25,24.15 18.25,16.45 19.23,15.47 Q2.2
N$22
  Top 0.61: T5.1 79.53,11.23 77.4,9.1 44.15,9.1 38.55,14.7 R11.1
N$23
  Top 0.406: Q2.1 IC1.3
N$24
  Top 0.61: R12.1 37.29,19.66 | 37.15,19.6 R12.1 | T6.1 80.57,8.05 43.45,8.05 37.15,14.35 R12.1
N$25
  Top 0.35: R14.1 16.76,33.61 IC1.14
N$26
  Top 0.61: T7.1 80.57,4.9 79.15,4.9 77.11,6.94 42.81,6.94 35.75,14 R13.1
N$28
  Top 0.305: IC1.17 IC1.18 IC1.19 12.45,29.6 12.65,29.4 12.65,28.35 12.62,28.32 IC1.21
  Top 0.35: C5.2 22.45,33.6 20.37,31.52 IC1.13 16.74,31.5 15.1,31.5 13.84,30.24 IC1.18
  Top 0.406: IC1.21 12.46,28.32 12.46,25.39 12.18,25.12 IC1.26
  Top 0.61: C3.2 C5.2
N$29
  Top 0.61: ESP.P$27 44.85,25.3 R17.1
  Top 1.016: R17.1 45.3,25.05 45.3,21.54 S2.2 S2.1
N$30
  Top 0.406: 13.04,23.84 IC1.28 | IC1.12 15.53,30.88 13.35,28.7 13.35,24.15 13.04,23.84 | C4.2 12.55,23.35 13.04,23.84
  Top 0.813: C4.2 C6.2
N$31
  Top 0.406: IC1.9 21.84,28.96 22.45,28.35 22.45,26.25 23.85,24.85 23.85,19.27 R2.2
N$32
  Top 0.152: X2.A7 9.05,31.6
  Top 0.305: X2.A7 11.26,31.6 IC1.16 11.36,31.5 12.65,31.5 13,31.85 13,32.55 12.65,32.9 9.85,32.9 9.55,32.6 X2.B7
N$33
  Top 0.152: 9.25,32.1 X2.A6 7.4,32.1 | 7.05,32.1 6.6,32.1
  Top 0.305: IC1.15 11.28,32.1 7.4,32.1 6.6,32.1 6.35,31.85 6.35,31.5 6.75,31.1 X2.B6
N$34
  Top 0.305: 8.45,33.1 X2.A5
  Top 0.35: X2.A5 9,33.1 9.5,33.6 10.55,33.6 11.95,35 R15.2
N$35
  Top 0.305: R16.2 9,30.1 X2.B5
N$36
  Top 0.61: X1.3 26.36,12.1 U$3.4
  Top 0.813: X1.3 26.25,13.7 24.2,15.75 R2.1
N$37
  Top 0.813: R1.2 44.95,29.75 R17.2
N$38
  Top 0.35: IC1.6 15.87,27.04 14.42,25.59 14.42,14.72 13,13.3 7.4,13.3 4.25,16.45 R3.1
N$39
  Top 0.813: R19.1 1.8,23 C13.1
RELAY_1
  Top 0.61: ESP.P$33 45.92,32.92 46.8,33.8 R4.2
RELAY_2
  Top 0.61: R5.2 46.95,31.65 ESP.P$32
RELAY_3
  Top 0.61: R6.2 46.95,42.9 46.95,35.7 45.44,34.19 ESP.P$34
VPP
  Top 1.016: K1.P 65.5,38.95 | 65.75,38.95 66.3,38.95 66.9,39.55 | 66.9,39.55 66.9,40.6 | 66.9,40.6 66.9,54.6 | 66.9,54.6 65.95,55.55 | 65.95,55.55 K3.P | 66.9,39.55 66.9,37.8 | 66.9,37.8 66.9,25.9 | 63.35,22.35 64.62,23.62 | 64.62,23.62 64.97,23.98 | 64.97,23.98 65.33,24.32 | 65.33,24.32 65.5,24.5 | 65.5,24.5 66.38,25.38 | 66.38,25.38 66.9,25.9 | K2.P 63.35,22.35 | 66.9,54.6 66.9,56.35 | 66.9,56.35 66.9,61.25 69,63.35 77.4,63.35 | 77.4,63.35 78.9,63.35 | 78.9,63.35 80.1,63.35 | 80.1,63.35 83.2,63.35 83.65,62.9 J5.1 | 65.95,55.55 66.1,55.55 66.9,56.35 | 65.75,38.95 65.5,38.95 | 65.75,38.95 66.9,37.8 | 65.5,38.95 65.5,39.2 66.9,40.6 | 63.35,22.35 65.15,22.35 | 65.15,22.35 65.85,22.35 | 65.85,22.35 66.55,22.35 | 66.55,22.35 67.6,22.35 | 67.6,22.35 68.65,22.35 | 68.65,22.35 69.35,22.35 | 69.35,22.35 70.4,22.35 | 70.4,22.35 78.3,22.35 R7.1 | 64.62,23.62 64.62,22.88 65.15,22.35 | 64.97,23.98 64.97,23.23 65.85,22.35 | 65.33,24.32 65.33,23.57 66.55,22.35 | 65.5,24.5 65.5,24.45 67.6,22.35 | 66.38,25.38 66.38,24.62 68.65,22.35 | 66.9,25.85 66.9,24.8 69.35,22.35 | 66.9,25.9 66.9,25.85 | 66.9,25.85 70.4,22.35 | J1.1 80.85,46.35 79,48.2 79,62.1 | 78.9,63.35 79,63.25 79,62.1 | 79,62.1 80.1,63.2 80.1,63.35 | 79,62.1 78.65,62.1 77.4,63.35
(copper drawn outside any net)
  shapes: Top area x9